# Altium project PCB_HEXAPODO.PrjPcb
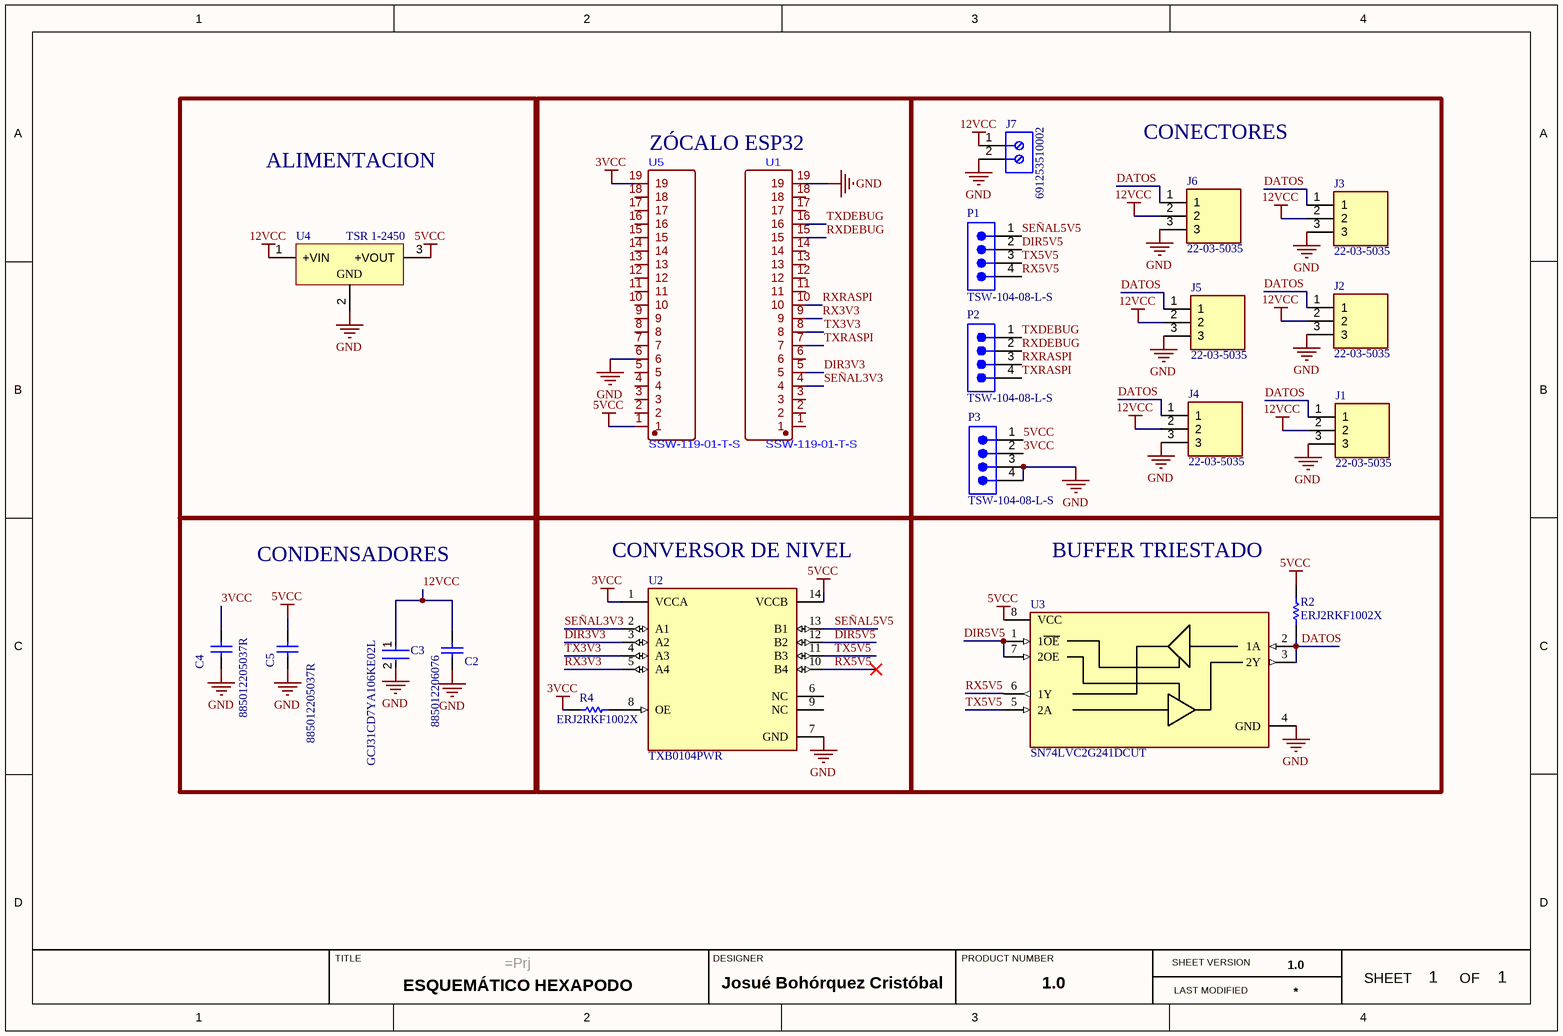
[diagram p0: ESQUEMÁTICO.SchDoc]
1 sheet, 21 parts. Net scope: global (net labels, ports and power ports of the same name join across sheets).
Board file: PCBHEXAPOD.PcbDoc

## Sheet ESQUEMÁTICO.SchDoc: ESQUEMÁTICO HEXAPODO
size A4; Revision: 1.0; SheetNumber: 1; SheetTotal: 1; Des: Josué Bohórquez Cristóbal; PN: 1.0

### Parts
C2  885012206076  [WCAP-CSGP_0603_L1.6W0.8H0.8_Reflow]
C3  GCJ31CD7YA106KE02L  [FP-GCJ31C-0_4-IPC_C]
C4  885012205037R  [WCAP-CSGP_0402_L1W0.5H0.5]
C5  885012205037R  [WCAP-CSGP_0402_L1W0.5H0.5]
J1  22-03-5035  [SHDR3W60P0X250_1X3_990X490X590P]
J2  22-03-5035  [SHDR3W60P0X250_1X3_990X490X590P]
J3  22-03-5035  [SHDR3W60P0X250_1X3_990X490X590P]
J4  22-03-5035  [SHDR3W60P0X250_1X3_990X490X590P]
J5  22-03-5035  [SHDR3W60P0X250_1X3_990X490X590P]
J6  22-03-5035  [SHDR3W60P0X250_1X3_990X490X590P]
J7  691253510002  [691253510002]
P1  TSW-104-08-L-S  [SMTC-TSW-104-08-X-S]
P2  TSW-104-08-L-S  [SMTC-TSW-104-08-X-S]
P3  TSW-104-08-L-S  [SMTC-TSW-104-08-X-S]
R2  ERJ2RKF1002X  [RESC1005X40X25LL05T05]
R4  ERJ2RKF1002X  [RESC1005X40X25LL05T05]
U1  SSW-119-01-T-S  [HDR-TH_ESW-119-37-S-S]
U2  TXB0104PWR  [Texas_Instruments_PW0014A_MFG]
U3  SN74LVC2G241DCUT  [FP-DCU0008A-IPC_A]
U4  TSR 1-2450  [TRACO-SIP-3_V]
U5  SSW-119-01-T-S  [HDR-TH_ESW-119-37-S-S]

### Blocks framed on the sheet
ALIMENTACION: U4
ZÓCALO ESP32: U1 U5
CONECTORES: J1-J7 P1-P3
CONDENSADORES: C2-C5
CONVERSOR DE NIVEL: R4 U2
BUFFER TRIESTADO: R2 U3

### Nets
3VCC: C4.2 P3.2 R4.2 U2.1(VCCA) U5.19
5VCC: C5.1 P3.1 R2.2 U2.14(VCCB) U3.8(VCC) U4.3(+VOUT) U5.1
12VCC: C2.2 C3.1 J1.2 J2.2 J3.2 J4.2 J5.2 J6.2 J7.1 U4.1(+VIN)
GND: C2.1 C3.2 C4.1 C5.2 J1.3 J2.3 J3.3 J4.3 J5.3 J6.3 J7.2 P3.3 P3.4 U1.19 U2.7(GND) U3.4(GND) U4.2(GND) U5.6
DATOS: J1.1 J2.1 J3.1 J4.1 J5.1 J6.1 R2.1 U3.2(1A) U3.3(2Y)
DIR3V3: U1.5 U2.3(A2)
DIR5V5: P1.2 U2.12(B2) U3.1(1~{OE}) U3.7(2OE)
RX3V3: U1.9 U2.5(A4)
RX5V5: P1.4 U2.10(B4) U3.6(1Y)
RXDEBUG: P2.2 U1.15
RXRASPI: P2.3 U1.10
SEÑAL3V3: U1.4 U2.2(A1)
SEÑAL5V5: P1.1 U2.13(B1)
TX3V3: U1.8 U2.4(A3)
TX5V5: P1.3 U2.11(B3) U3.5(2A)
TXDEBUG: P2.1 U1.16
TXRASPI: P2.4 U1.7
NetR4_1: R4.1 U2.8(OE)

Not connected (* = marked no-connect by the designer): U1 1 2 3 6 11 12 13 14 17 18; U2 6(NC) 9(NC); U5 2 3 4 5 7 8 9 10 11 12 13 14 15 16 17 18

### Notes on the sheet
- TITLE
- DESIGNER
- PRODUCT NUMBER
- SHEET VERSION
- LAST MODIFIED
- SHEET
- OF

### Library data of the parts
C2 = CMP-03913-53914785-2: 1UF Multilayer Ceramic Capacitor Mlcc 25 V , X7R Dielectric 0603 Surface Mount; Voltage Rating: 25V; Tolerance: 10%; Capacitance: 1µF; Insulation Resistance: 500MΩ; Height: 800µm; Case Code (Metric): 1608; Min Operating Temperature: -55°C; Dielectric: X7R; Material: Ceramic; REACH SVHC: Unknown; Case/Package: 0603; Width: 800µm; Case Code (Imperial): 0603; Length: 1.6mm; Mount: Surface Mount; Max Operating Temperature: 125°C; RoHS: Compliant; Thickness: 939.8µm; Voltage Rating (DC): 25V
C3 = CMP-06035-004889-1: Cap Ceramic 10uF 35V X7T 10% SMD 1206 +125°C Embossed Plastic T/R
C4 C5 = CMP-03913-130590225-1: Cap, 0.1Uf, 16V, Mlcc, 0402 Rohs Compliant: Yes; Insulation Resistance: 5GΩ; Capacitance: 100nF; Min Operating Temperature: -55°C; Voltage Rating: 16V; Height: 500µm; Max Operating Temperature: 125°C; Width: 500µm; RoHS: Compliant; Length: 1mm
J1-J6 = 22-03-5035: Header 2.5mm SPOX,WTB,vert, shrouded, 3w Molex SPOX Series, Series Number 5267, 2.5mm Pitch 3 Way 1 Row Straight PCB Header, Solder Termination, 3A; Geometry.Height: 5.9mm; Mouser Part Number: 538-22-03-5035; Mouser Price/Stock: https://www.mouser.co.uk/ProductDetail/Molex/22-03-5035?qs=VKrXD49J9Ep%252Bv2WwbOoiPA%3D%3D; Manufacturer_Name: Molex; Manufacturer_Part_Number: 22-03-5035; Datasheet Link: http://www.molex.com/pdm_docs/sd/022035035_sd.pdf
J7 = CMP-1502-02670-3: Terminal Block, Wtb, 2Way, 30-12Awg Rohs Compliant: Yes; Number of Contacts: 2; Voltage Rating: 300V; Current Rating: 16A; Min Operating Temperature: -30°C; RoHS: Compliant; Number of Rows: 1; Max Operating Temperature: 120°C; Height: 18.1mm; Contact Material: Nickel, Tin
P1-P3 = CMP-1024-00358-1: 0.025" SQ Post Header, Through-hole, Vertical, -55 to 125 degC, 2.54 mm Pitch, 4-Pin, Male, RoHS; Manufacturer: Samtec; Pitch: 2.54 mm; PartNumber: TSW-104-08-L-S; RoHS: True; Temperature Range: -55 to 125 degC; PackageDescription: .025[0.64] SQ. Post Terminal Strip Assembly; Orientation: Vertical; ComponentLink2URL: http://www.samtec.com/documents/webfiles/pdf/TSW_TH.PDF; ComponentLink1Description: Manufacturer URL; ComponentLink2Description: Datasheet; PackageVersion: DM, 8/1988; ComponentLink3URL: http://www.samtec.com/documents/webfiles/cpdf/TSW-XXX-XX-XXX-X-XX-XXX-MKT.pdf; Mounting Technology: Through-hole; PackageReference: TSW-104-08-X-S; ComponentLink3Description: Package Specification; ComponentLink1URL: http://www.samtec.com; DatasheetVersion: F-214
R2 R4 = CMP-2000-07588-1: Chip Resistor, 10 KOhm, +/- 1%, 0.1 W, -55 to 155 degC, 0402 (1005 Metric), RoHS, Tape and Reel; Manufacturer: Panasonic; Power Rating: 100mW; Voltage Rating: 50V; Resistance: 10KOhm; Case\/Package: 0402; Temperature Coefficient: 100ppm\/degreesC; RoHSCompliant: True; Lead Free: LeadFree; Package Quantity: 1; Contact Plating: Tin; Length: 1mm; Radiation Hardening: No; REACH SVHC: NoSVHC; Max Operating Temperature: 155degC; Depth: 0.5mm; Case Code (Imperial): 0402; Military Standard: Not; Package Description: 2-Pin Surface Mount Device, Body 1 x 0.5 mm; Termination: SMD/SMT; Case Code (Metric): 1005; Height: 0.35mm; Packaging: TapeandReel; Voltage Rating (DC): 50V; Package Reference: 402; Number of Pins: 2; Tolerance: 1%; Mounting Technology: SurfaceMount; Width: 0.02inch; Mount: SurfaceMount; Datasheet URL: https://industrial.panasonic.com/cdbs/www-data/pdf/RDA0000/AOA0000C304.pdf; Composition: ThickFilm; Datasheet Version: 02/2017; Manufacturer URL: http://www.panasonic.com/; Max Power Dissipation: 100mW; Number of Terminations: 2; Min Operating Temperature: -55degC
U2 = CMP-2000-07335-2: NexarPartId: 1486292; Manufacturer Lifecycle Status: ACTIVE; Quiescent Current: 3.5µA; Number of Circuits: 1; Logic Function: Translator; Number of Bits: 4; Max Supply Voltage: 5.5V; Low Level Output Current: 20µA; Data Rate: 100Mbps; Nominal Supply Current: 5µA; Turn-On Delay Time: 31ns; Propagation Delay: 4ns; High Level Output Current: -20µA; Min Supply Voltage: 1.2V; Rise Time: 700ps; Max Junction Temperature (Tj): 150°C; Number of Outputs: 4; Ambient Temperature Range High: 85°C; Width: 4.4mm; Height: 1.2mm; Radiation Hardening: No; Case/Package: TSSOP; Number of Inputs: 4; Packaging: Digi-Reel®; RoHS: Compliant; Weight: 57.209338mg; Length: 5mm; REACH SVHC: No SVHC; Min Supply Voltage (DC): 1.2V; Min Operating Temperature: -40°C; Number of Channels: 4; Number of Pins: 14; Schedule B: 8542390000, 8542390000; Max Operating Temperature: 85°C; Output Current: 20µA; Thickness: 1mm; Lead Free: Lead Free; Lifecycle Status: Production; Mount: Surface Mount
U3 = CMP-0859-00583-4: IC BUFFER NON-INVERT 5.5V US8; Number of Gates: 2; High Level Output Current: -32mA; Number of Bits per Element: 1; Quiescent Current: 10uA; Low Level Output Current: 32mA; Polarity: Non-Inverting; Min Supply Voltage: 1.65V; Output Type: 3-STATE; Turn-On Delay Time: 12.5ns; Propagation Delay: 3.7ns; Lead Free: Lead Free; RoHS Compliant: Yes; Number of Bits: 2; Case/Package: VSSOP; Package Quantity: 250; Mount: Surface Mount; Number of Input Lines: 2; Number of Channels: 2; Packaging: Tape and Reel; Logic Function: Buffer; Max Supply Voltage: 5.5V; Number of Outputs: 2; Series: 74LVC; Termination: SMD/SMT; Number of Pins: 8; Technology: CMOS; Contact Plating: Gold; Number of Output Lines: 2; Min Operating Temperature: -40°C; Number of Elements: 2; Max Operating Temperature: 125°C; Radiation Hardening: No; REACH SVHC: No SVHC; Number of Inputs: 2
U4 = CMP-2000-05427-1: DC/DC converter, 5 VDC, 1000 mA, -40 to 85 degC, 3-Pin SIP, RoHS; Manufacturer: Tracopower; Output Voltage Nom.: 5V; Output Current Max: 1A; Product Range: TSR-1Series; DC / DC Converter Mounting: ThroughHole; Output Power Max: 5W; No. of Outputs: 1Output; Input Voltage DC Max: 36V; Approvals & Standards: IEC,UL; Input Voltage DC Min: 6.5V; DC / DC Converter Output Type: Fixed; Depth: 11.7mm; Package Reference: SIP-3; DC / DC Converter Type: SIP; Height: 10.2mm; Width: 7.6mm; Package Description: 3-Pin Single In-line Package, Body 11.7 x 7.6 mm, Pitch 2.54 mm; Manufacturer URL: http://www.tracopower.com/home; Datasheet Version: Jan-15; Datasheet URL: https://datasheet.ciiva.com/6815/tsr1-6815641.pdf